# Altium schematic sheet PAGE1.SchDoc
size 1071 x 817 mm
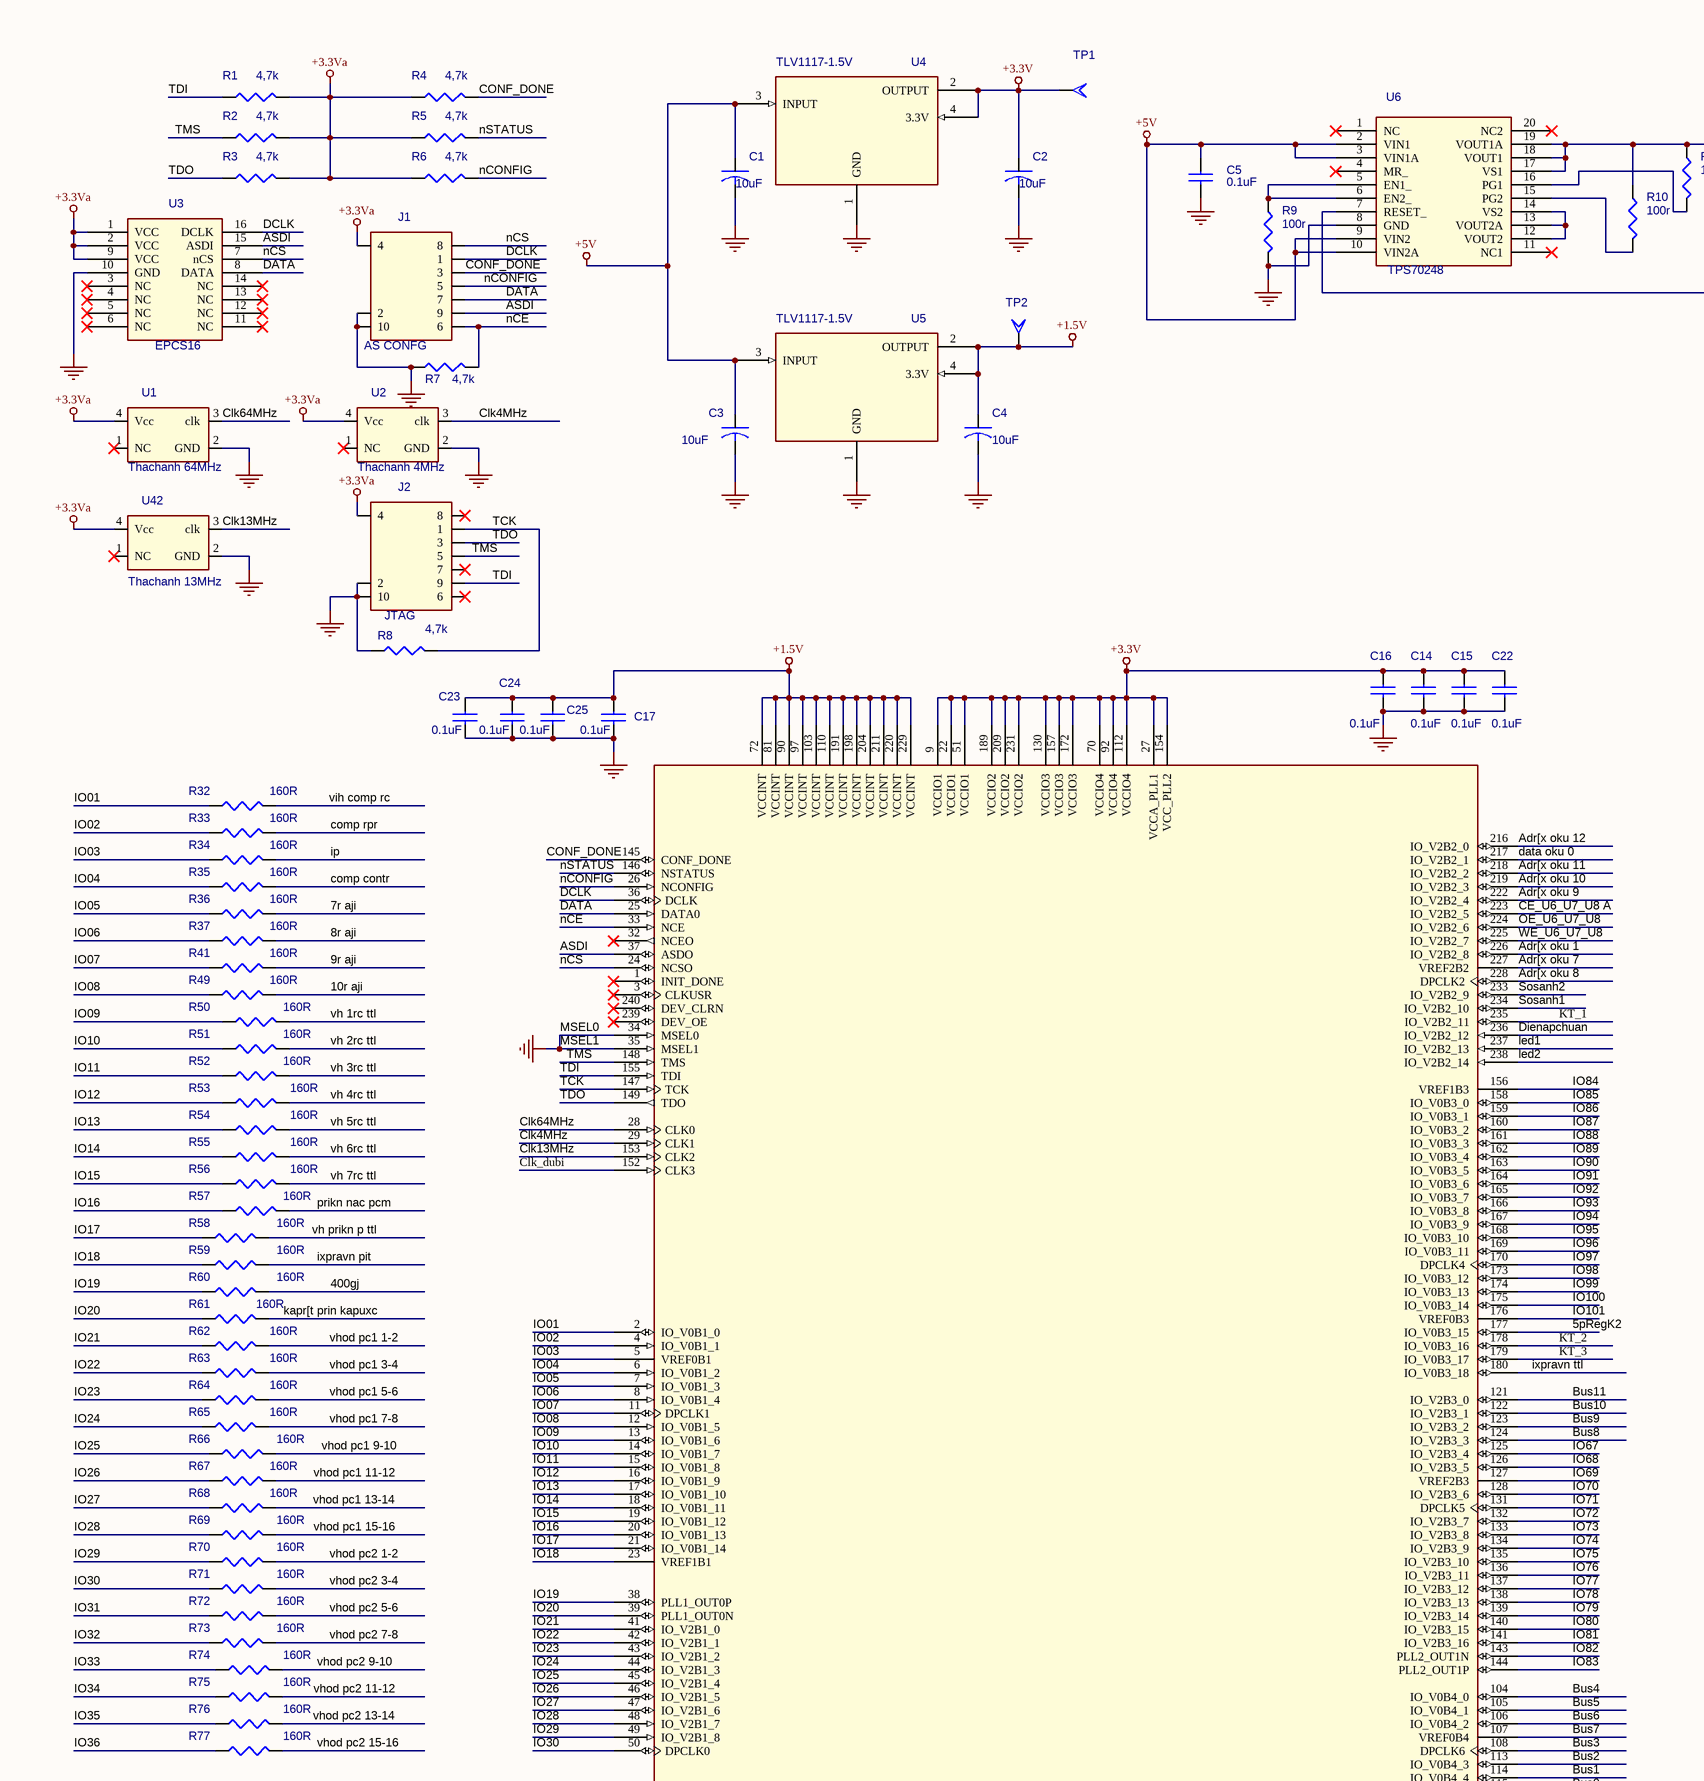
[diagram p0: PAGE1.SchDoc, top left]
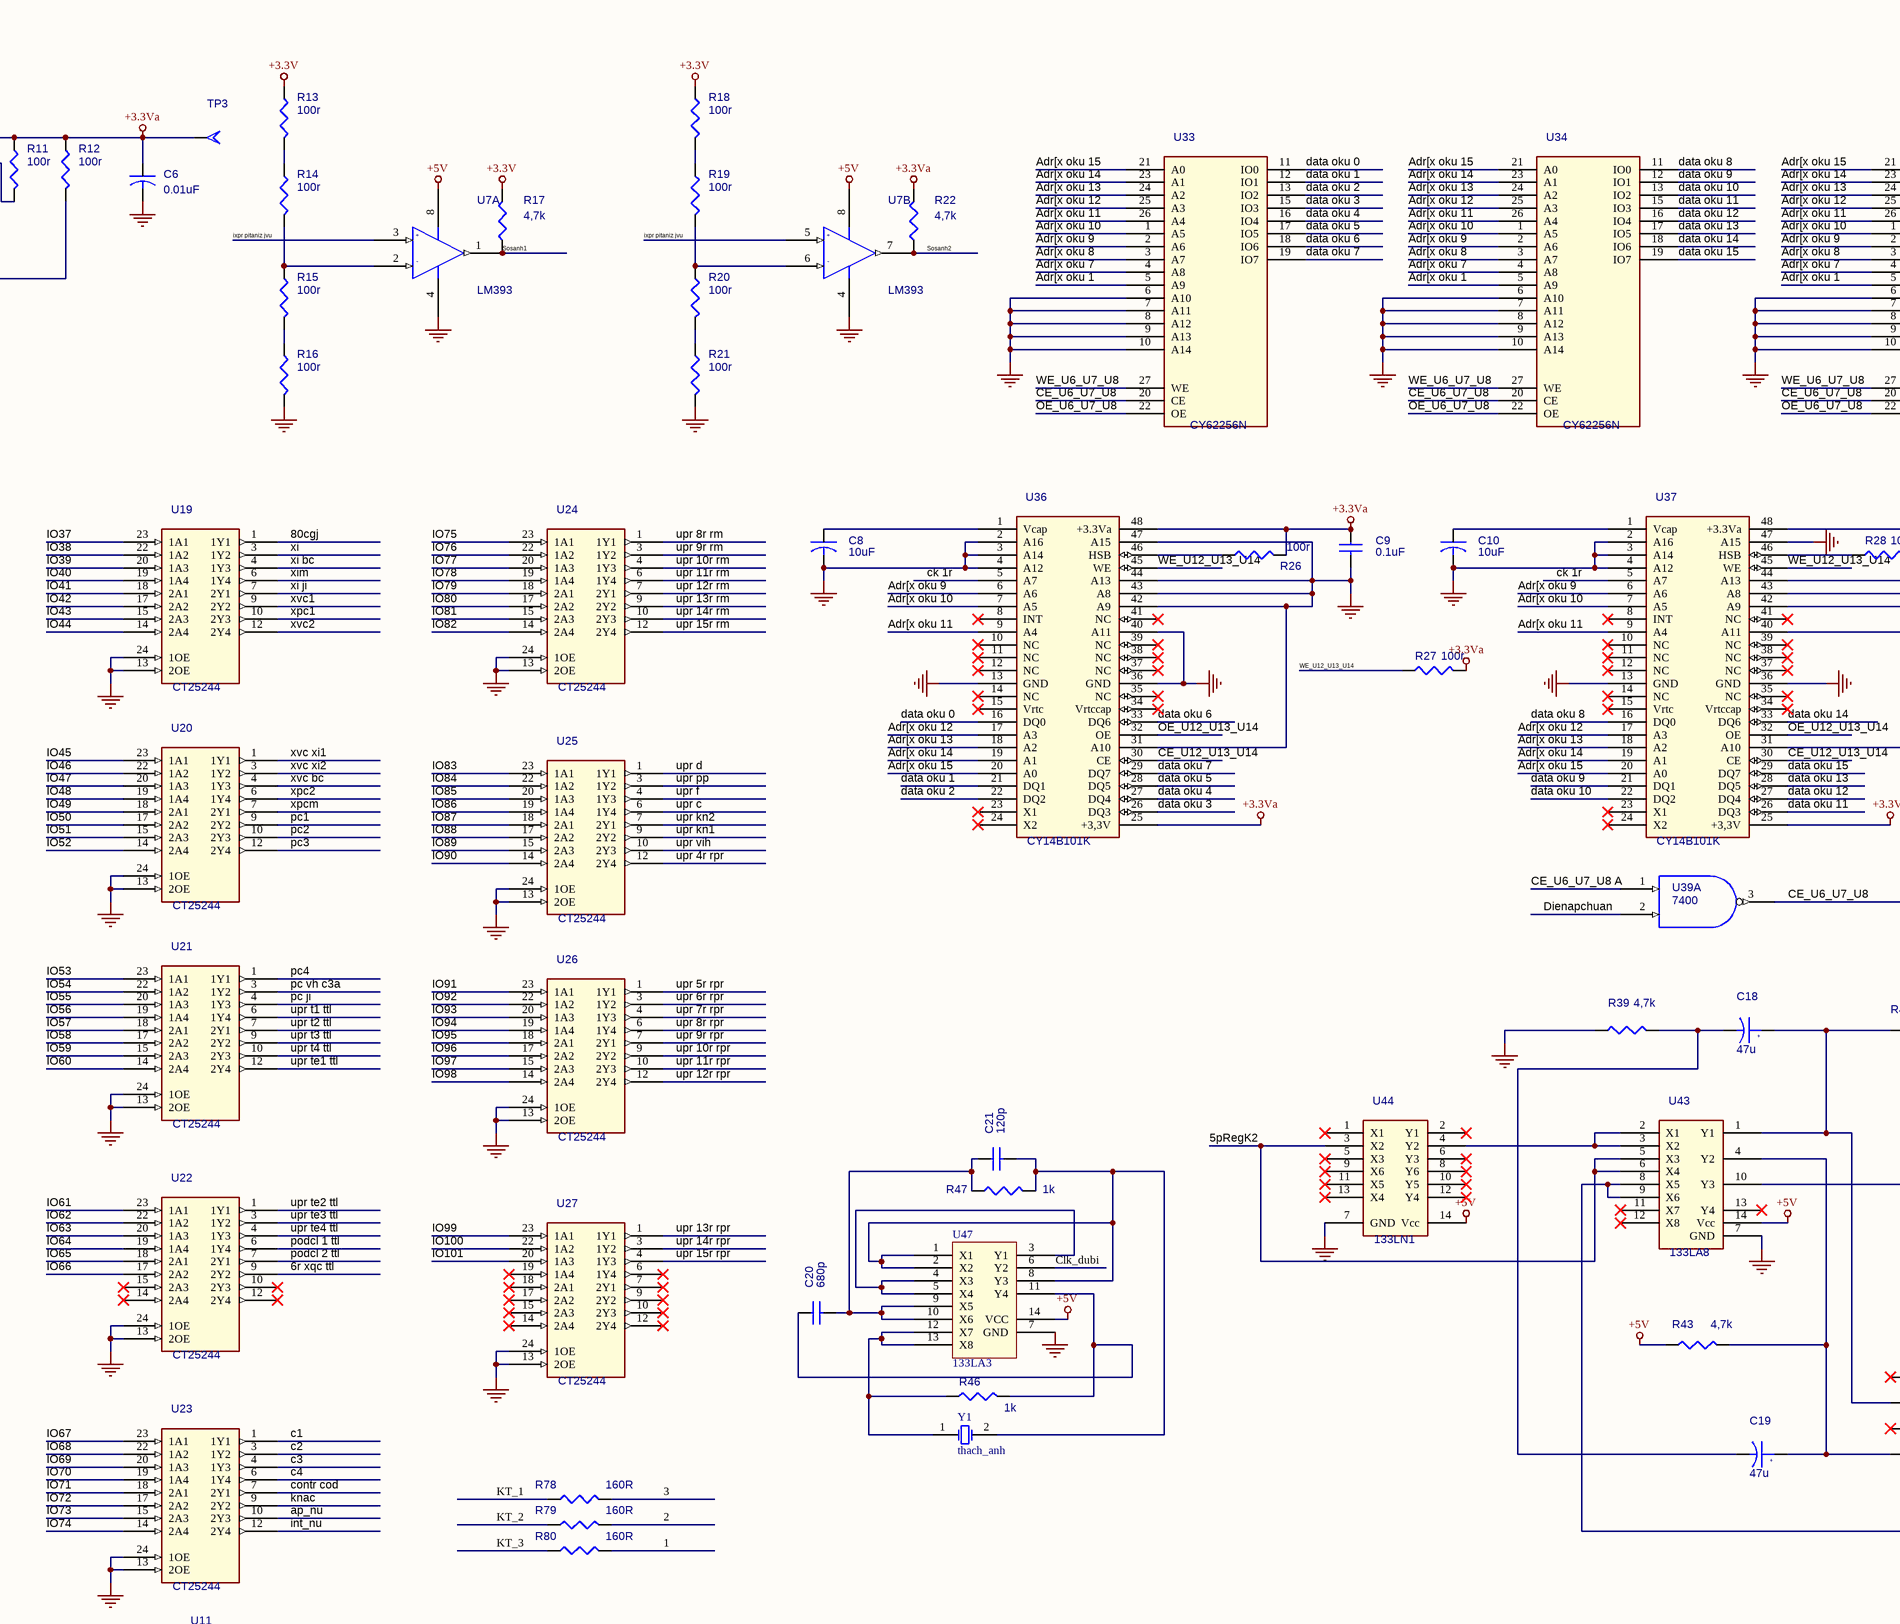
[diagram p1: PAGE1.SchDoc, top middle]
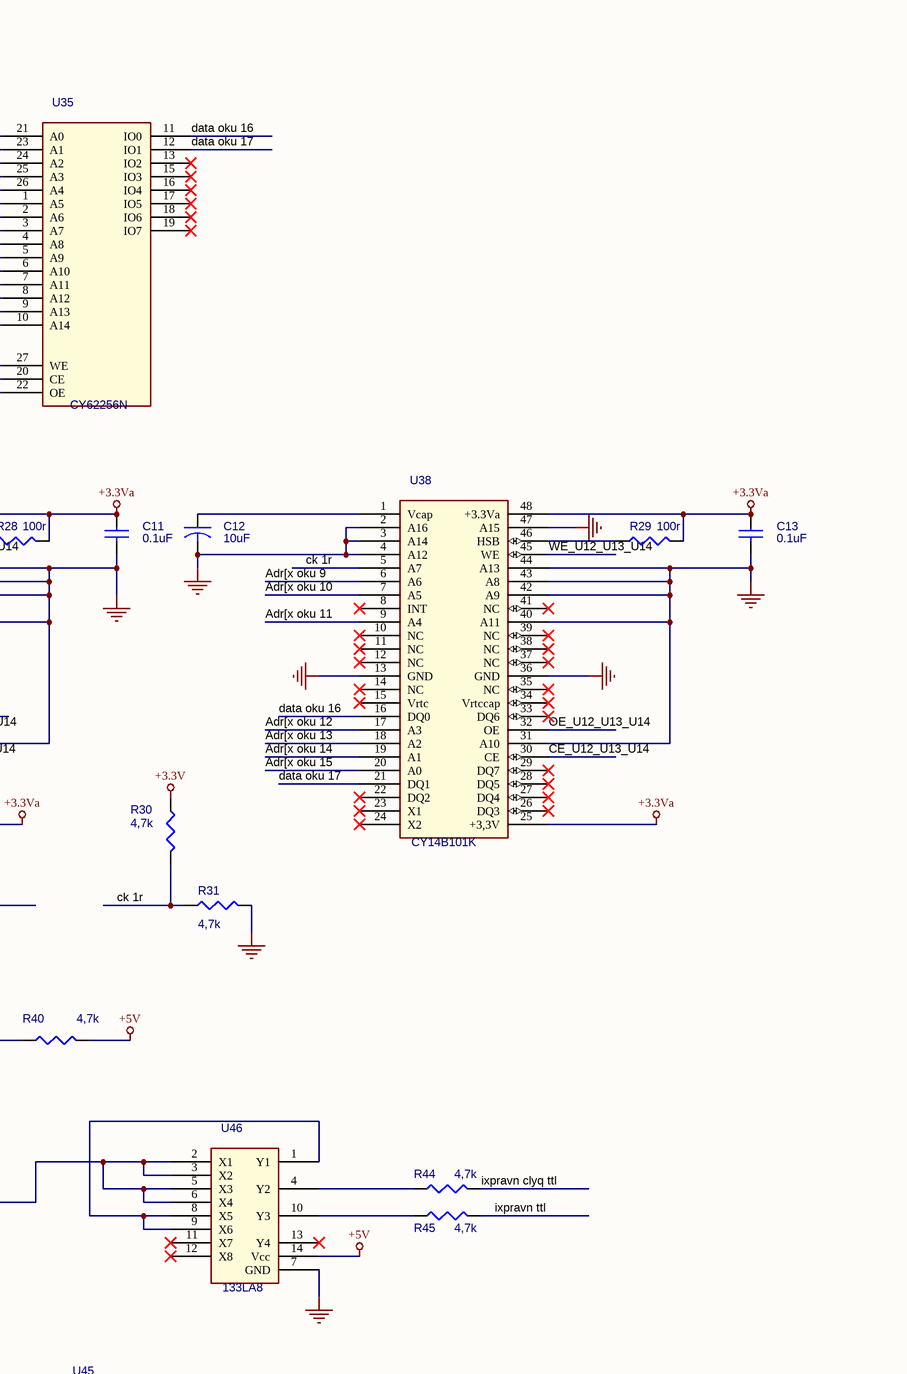
[diagram p2: PAGE1.SchDoc, top right]
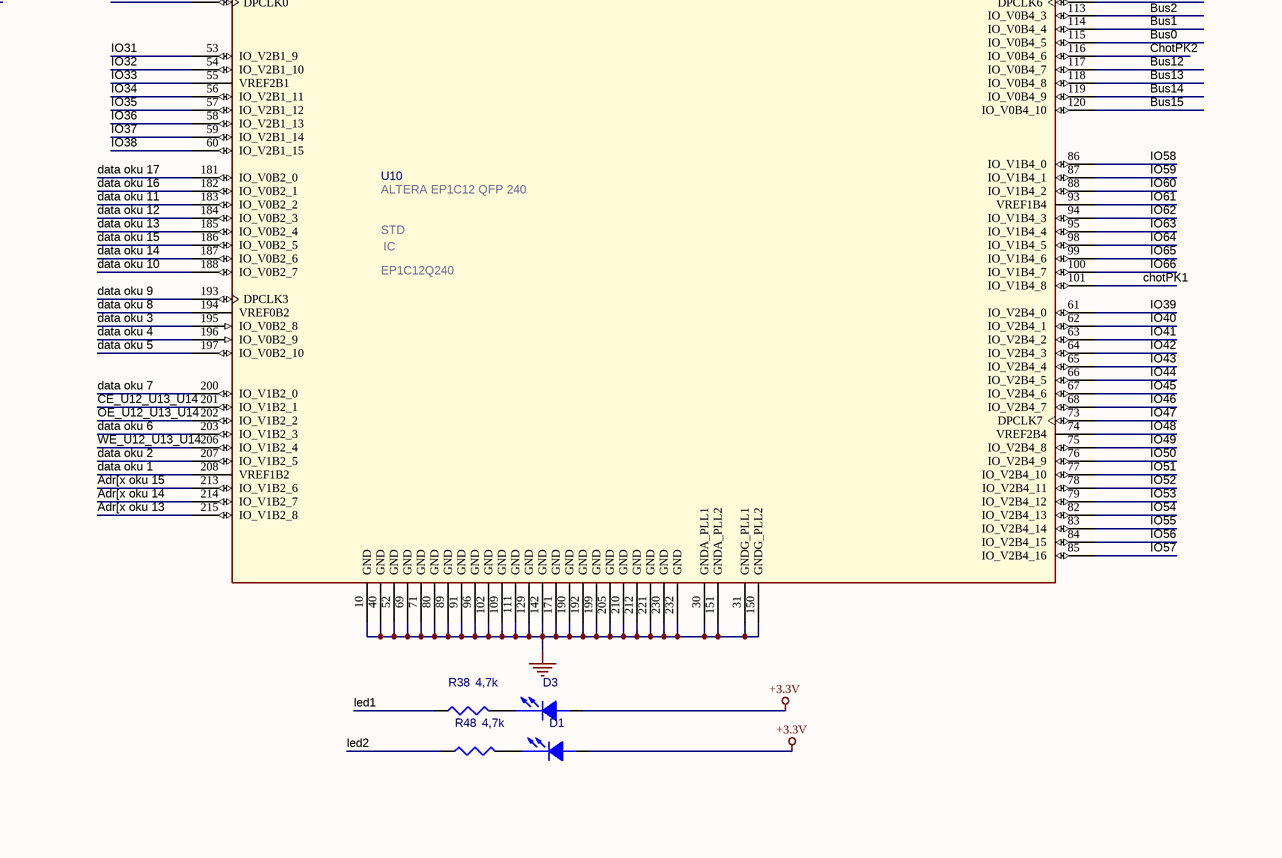
[diagram p3: PAGE1.SchDoc, centre left]
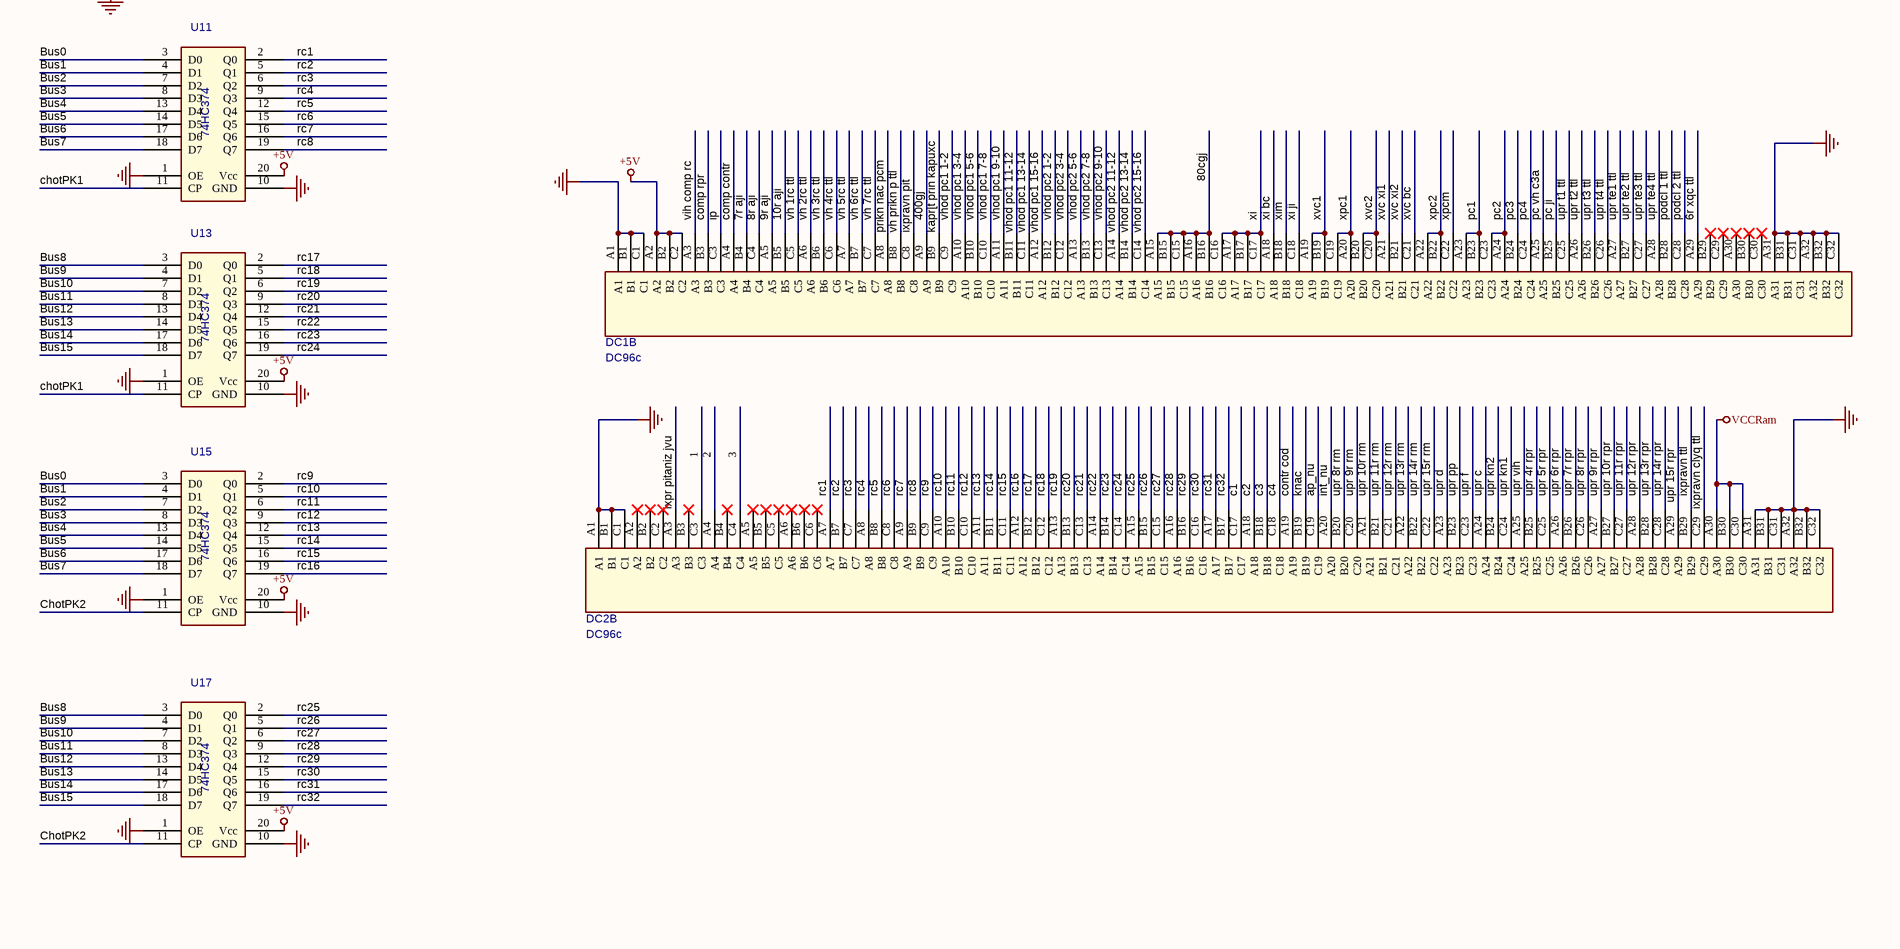
[diagram p4: PAGE1.SchDoc, centre middle]
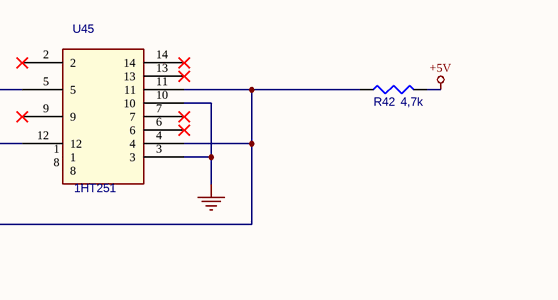
[diagram p5: PAGE1.SchDoc, centre right]
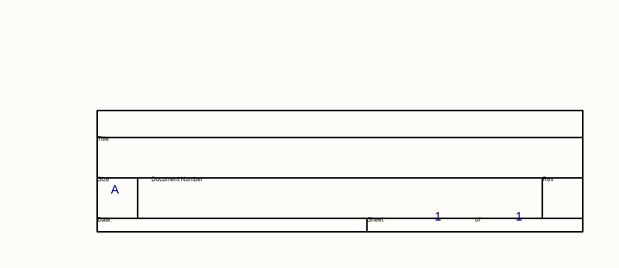
[diagram p6: PAGE1.SchDoc, bottom right]

## Parts
*  Page Size: A  Page Number: 1  (hidden comment: TitleBlock0)  (graphical)
C1  10uF  [tudien]
C2  10uF  [tudien]
C3  10uF  [tudien]
C4  10uF  [tudien]
C5  0.1uF  [C1206]
C6  0.01uF  [tudien]
C8  10uF  [tudien]
C9  0.1uF  [C1206]
C10  10uF  [tudien]
C11  0.1uF  [C1206]
C12  10uF  [tudien]
C13  0.1uF  [C1206]
C14  0.1uF  [C1206]
C15  0.1uF  [C1206]
C16  0.1uF  [C1206]
C17  0.1uF  [C1206]
C18  47u  [tudien]
C19  47u  [tudien]
C20  680p  [C1206]
C21  120p  [C1206]
C22  0.1uF  [C1206]
C23  0.1uF  [C1206]
C24  0.1uF  [C1206]
C25  0.1uF  [C1206]
D1  LED  [3.5X2.8X1.9]  (value not drawn)
D3  LED  [3.5X2.8X1.9]  (value not drawn)
DC1B  DC96c  [DC96c_DUC]
DC2B  DC96c  [DC96c_DUC]
J1  AS CONFG  [HDR2X5]
J2  JTAG  [HDR2X5]
R1  4,7k  [6-0805_N]
R2  4,7k  [6-0805_N]
R3  4,7k  [6-0805_N]
R4  4,7k  [6-0805_N]
R5  4,7k  [6-0805_N]
R6  4,7k  [6-0805_N]
R7  4,7k  [6-0805_N]
R8  4,7k  [6-0805_N]
R9  100r  [6-0805_N]
R10  100r  [6-0805_N]
R11  100r  [6-0805_N]
R12  100r  [6-0805_N]
R13  100r  [6-0805_N]
R14  100r  [6-0805_N]
R15  100r  [6-0805_N]
R16  100r  [6-0805_N]
R17  4,7k  [6-0805_N]
R18  100r  [6-0805_N]
R19  100r  [6-0805_N]
R20  100r  [6-0805_N]
R21  100r  [6-0805_N]
R22  4,7k  [6-0805_N]
R26  100r  [6-0805_N]
R27  100r  [6-0805_N]
R28  100r  [6-0805_N]
R29  100r  [6-0805_N]
R30  4,7k  [6-0805_N]
R31  4,7k  [6-0805_N]
R32  160R  [6-0805_N]
R33  160R  [6-0805_N]
R34  160R  [6-0805_N]
R35  160R  [6-0805_N]
R36  160R  [6-0805_N]
R37  160R  [6-0805_N]
R38  4,7k  [6-0805_N]
R39  4,7k  [6-0805_N]
R40  4,7k  [6-0805_N]
R41  160R  [6-0805_N]
R42  4,7k  [6-0805_N]
R43  4,7k  [6-0805_N]
R44  4,7k  [6-0805_N]
R45  4,7k  [6-0805_N]
R46  1k  [6-0805_N]
R47  1k  [6-0805_N]
R48  4,7k  [6-0805_N]
R49  160R  [6-0805_N]
R50  160R  [6-0805_N]
R51  160R  [6-0805_N]
R52  160R  [6-0805_N]
R53  160R  [6-0805_N]
R54  160R  [6-0805_N]
R55  160R  [6-0805_N]
R56  160R  [6-0805_N]
R57  160R  [6-0805_N]
R58  160R  [6-0805_N]
R59  160R  [6-0805_N]
R60  160R  [6-0805_N]
R61  160R  [6-0805_N]
R62  160R  [6-0805_N]
R63  160R  [6-0805_N]
R64  160R  [6-0805_N]
R65  160R  [6-0805_N]
R66  160R  [6-0805_N]
R67  160R  [6-0805_N]
R68  160R  [6-0805_N]
R69  160R  [6-0805_N]
R70  160R  [6-0805_N]
R71  160R  [6-0805_N]
R72  160R  [6-0805_N]
R73  160R  [6-0805_N]
R74  160R  [6-0805_N]
R75  160R  [6-0805_N]
R76  160R  [6-0805_N]
R77  160R  [6-0805_N]
R78  160R  [6-0805_N]
R79  160R  [6-0805_N]
R80  160R  [6-0805_N]
TP1  T POINT A  [PIN1]  (value not drawn)
TP2  T POINT A  [PIN1]  (value not drawn)
TP3  T POINT A  [PIN1]  (value not drawn)
U1  Thachanh 64MHz  [Thachanh64mhz]
U2  Thachanh 4MHz  [Thachanh64mhz]
U3  EPCS16  [EPCS16]
U4  SymName: TLV1117-1.5V  [SOT223_N]  (hidden comment: tlv1117cdcy)
U5  SymName: TLV1117-1.5V  [SOT223_N]  (hidden comment: tlv1117cdcy)
U6  TPS70248  [TPS70248]
U7  LM393  [SO8_N]  (parts A,B of 2)
U10  CLASS: IC  LEVEL: STD  DEVICE: ALTERA EP1C12 QFP 240  [PQFP240_N]  (hidden comment: EP1C12Q240)
U11  74HC374  [SOIC20/74HC374]
U13  74HC374  [SOIC20/74HC374]
U15  74HC374  [SOIC20/74HC374]
U17  74HC374  [SOIC20/74HC374]
U19  CT25244  [CT25244]
U20  CT25244  [CT25244]
U21  CT25244  [CT25244]
U22  CT25244  [CT25244]
U23  CT25244  [CT25244]
U24  CT25244  [CT25244]
U25  CT25244  [CT25244]
U26  CT25244  [CT25244]
U27  CT25244  [CT25244]
U33  CY62256N  [S22_N]
U34  CY62256N  [S22_N]
U35  CY62256N  [S22_N]
U36  CY14B101K  [O48]
U37  CY14B101K  [O48]
U38  CY14B101K  [O48]
U39  7400  [7400]  (part A of 4)
U42  Thachanh 13MHz  [Thachanh64mhz]
U43  133LA8  [133LA8]
U44  133LN1  [133LA8]
U45  1HT251  [133LA8]
U46  133LA8  [133LA8]
U47  133LA3  [133LA8]
Y1  thach_anh  [OCPG_07]

## Nets
+1.5V: C4.1 C17.1 C23.1 C24.1 C25.1 TP2.1(TP) U5.2(OUTPUT) U5.4(3.3V) U10.72(VCCINT) U10.81(VCCINT) U10.90(VCCINT) U10.97(VCCINT) U10.103(VCCINT) U10.110(VCCINT) U10.191(VCCINT) U10.198(VCCINT) U10.204(VCCINT) U10.211(VCCINT) U10.220(VCCINT) U10.229(VCCINT)
+3.3V: C2.1 C14.1 C15.1 C16.1 C22.1 D1.1(ANODE) D3.1(ANODE) R13.1 R17.1 R18.1 R30.1 TP1.1(TP) U4.2(OUTPUT) U4.4(3.3V) U10.9(VCCIO1) U10.22(VCCIO1) U10.27(VCCA_PLL1) U10.51(VCCIO1) U10.70(VCCIO4) U10.92(VCCIO4) U10.112(VCCIO4) U10.130(VCCIO3) U10.154(VCC_PLL2) U10.157(VCCIO3) U10.172(VCCIO3) U10.189(VCCIO2) U10.209(VCCIO2) U10.231(VCCIO2)
+3.3Va: C6.1 C9.1 C11.1 C13.1 J1.4 J2.4 R1.2 R2.2 R3.2 R4.1 R5.1 R6.1 R10.1 R11.1 R12.1 R22.1 R26.2 R27.2 R28.2 R29.2 TP3.1(TP) U1.4(Vcc) U2.4(Vcc) U3.1(VCC) U3.2(VCC) U3.9(VCC) U6.17(VS1) U6.18(VOUT1) U6.19(VOUT1A) U19.16(+5V) U19.21(+5V) U20.16(+5V) U20.21(+5V) U21.16(+5V) U21.21(+5V) U22.16(+5V) U22.21(+5V) U23.16(+5V) U23.21(+5V) U24.16(+5V) U24.21(+5V) U25.16(+5V) U25.21(+5V) U26.16(+5V) U26.21(+5V) U27.16(+5V) U27.21(+5V) U36.25(+3,3V) U36.48(+3.3Va) U37.25(+3,3V) U37.48(+3.3Va) U38.25(+3,3V) U38.48(+3.3Va) U42.4(Vcc)
+5V: C1.1 C3.1 C5.1 DC1B.A2 DC1B.B2 DC1B.C2 R40.2 R42.2 R43.1 U4.3(INPUT) U5.3(INPUT) U6.2(VIN1) U6.3(VIN1A) U6.9(VIN2) U6.10(VIN2A) U7.8(V+) U11.20(Vcc) U13.20(Vcc) U15.20(Vcc) U17.20(Vcc) U43.14(Vcc) U44.14(Vcc) U46.14(Vcc) U47.14(VCC)
MSEL0: C1.2 C2.2 C3.2 C4.2 C5.2 C6.2 C8.2 C9.2 C10.2 C11.2 C12.2 C13.2 C14.2 C15.2 C16.2 C17.2 C22.2 C23.2 C24.2 C25.2 DC1B.A1 DC1B.A31 DC1B.A32 DC1B.B1 DC1B.B31 DC1B.B32 DC1B.C1 DC1B.C31 DC1B.C32 DC2B.A1 DC2B.A31 DC2B.A32 DC2B.B1 DC2B.B31 DC2B.B32 DC2B.C1 DC2B.C31 DC2B.C32 J1.2 J1.10 J2.2 J2.10 R7.2 R8.1 R9.2 R16.2 R21.2 R31.2 R39.1 U1.2(GND) U2.2(GND) U3.10(GND) U4.1(GND) U5.1(GND) U6.8(GND) U7.4(V-) U10.10(GND) U10.30(GNDA_PLL1) U10.31(GNDG_PLL1) U10.34(MSEL0) U10.35(MSEL1) U10.40(GND) U10.52(GND) U10.69(GND) U10.71(GND) U10.80(GND) U10.89(GND) U10.91(GND) U10.96(GND) U10.102(GND) U10.109(GND) U10.111(GND) U10.129(GND) U10.142(GND) U10.150(GNDG_PLL2) U10.151(GNDA_PLL2) U10.171(GND) U10.190(GND) U10.192(GND) U10.199(GND) U10.205(GND) U10.210(GND) U10.212(GND) U10.221(GND) U10.230(GND) U10.232(GND) U11.1(OE) U11.10(GND) U13.1(OE) U13.10(GND) U15.1(OE) U15.10(GND) U17.1(OE) U17.10(GND) U19.2(GND) U19.5(GND) U19.8(GND) U19.11(GND) U19.13(2OE) U19.24(1OE) U20.2(GND) U20.5(GND) U20.8(GND) U20.11(GND) U20.13(2OE) U20.24(1OE) U21.2(GND) U21.5(GND) U21.8(GND) U21.11(GND) U21.13(2OE) U21.24(1OE) U22.2(GND) U22.5(GND) U22.8(GND) U22.11(GND) U22.13(2OE) U22.24(1OE) U23.2(GND) U23.5(GND) U23.8(GND) U23.11(GND) U23.13(2OE) U23.24(1OE) U24.2(GND) U24.5(GND) U24.8(GND) U24.11(GND) U24.13(2OE) U24.24(1OE) U25.2(GND) U25.5(GND) U25.8(GND) U25.11(GND) U25.13(2OE) U25.24(1OE) U26.2(GND) U26.5(GND) U26.8(GND) U26.11(GND) U26.13(2OE) U26.24(1OE) U27.2(GND) U27.5(GND) U27.8(GND) U27.11(GND) U27.13(2OE) U27.24(1OE) U33.6(A10) U33.7(A11) U33.8(A12) U33.9(A13) U33.10(A14) U33.14(GND) U34.6(A10) U34.7(A11) U34.8(A12) U34.9(A13) U34.10(A14) U34.14(GND) U35.6(A10) U35.7(A11) U35.8(A12) U35.9(A13) U35.10(A14) U35.14(GND) U36.2(A16) U36.3(A14) U36.4(A12) U36.13(GND) U36.31(A10) U36.36(GND) U36.40(A11) U36.42(A9) U36.43(A8) U36.44(A13) U36.47(A15) U37.2(A16) U37.3(A14) U37.4(A12) U37.13(GND) U37.31(A10) U37.36(GND) U37.40(A11) U37.42(A9) U37.43(A8) U37.44(A13) U37.47(A15) U38.2(A16) U38.3(A14) U38.4(A12) U38.13(GND) U38.31(A10) U38.36(GND) U38.40(A11) U38.42(A9) U38.43(A8) U38.44(A13) U38.47(A15) U39.7(GND) U42.2(GND) U43.7(GND) U44.7(GND) U45.3 U45.10 U46.7(GND) U47.7(GND)  [also labelled GND, MSEL1]
VCCRam: DC2B.A30 DC2B.B30 DC2B.C30 U33.28(VCCRam) U34.28(VCCRam) U35.28(VCCRam) U39.14(+5V)
1: DC2B.C3 R80.2
2: DC2B.A4 R79.2
3: DC2B.C4 R78.2
5pRegK2: U10.177(IO_V0B3_15) U43.5(X3) U43.6(X4) U44.3(X2)
6r xqc ttl: DC1B.A29 U22.9(2Y2)
7r aji: DC1B.B4 R36.2
8r aji: DC1B.C4 R37.2
9r aji: DC1B.A5 R41.2
10r aji: DC1B.B5 R49.2
80cgj: DC1B.A15 DC1B.A16 DC1B.B15 DC1B.B16 DC1B.C15 U19.1(1Y1)
400gj: DC1B.A9 R60.2
Adr[x oku 1: U10.226(IO_V2B2_8) U33.5(A9) U34.5(A9) U35.5(A9)
Adr[x oku 7: U10.227(VREF2B2) U33.4(A8) U34.4(A8) U35.4(A8)
Adr[x oku 8: U10.228(DPCLK2) U33.3(A7) U34.3(A7) U35.3(A7)
Adr[x oku 9: U10.222(IO_V2B2_4) U33.2(A6) U34.2(A6) U35.2(A6) U36.6(A6) U37.6(A6) U38.6(A6)
Adr[x oku 10: U10.219(IO_V2B2_3) U33.1(A5) U34.1(A5) U35.1(A5) U36.7(A5) U37.7(A5) U38.7(A5)
Adr[x oku 11: U10.218(IO_V2B2_2) U33.26(A4) U34.26(A4) U35.26(A4) U36.9(A4) U37.9(A4) U38.9(A4)
Adr[x oku 12: U10.216(IO_V2B2_0) U33.25(A3) U34.25(A3) U35.25(A3) U36.17(A3) U37.17(A3) U38.17(A3)
Adr[x oku 13: U10.215(IO_V1B2_8) U33.24(A2) U34.24(A2) U35.24(A2) U36.18(A2) U37.18(A2) U38.18(A2)
Adr[x oku 14: U10.214(IO_V1B2_7) U33.23(A1) U34.23(A1) U35.23(A1) U36.19(A1) U37.19(A1) U38.19(A1)
Adr[x oku 15: U10.213(IO_V1B2_6) U33.21(A0) U34.21(A0) U35.21(A0) U36.20(A0) U37.20(A0) U38.20(A0)
ap_nu: DC2B.C19 U23.10(2Y3)
ASDI: J1.9 U3.15(ASDI) U10.37(ASDO)
Bus0: U10.115(IO_V0B4_5) U11.3(D0) U15.3(D0)
Bus1: U10.114(IO_V0B4_4) U11.4(D1) U15.4(D1)
Bus2: U10.113(IO_V0B4_3) U11.7(D2) U15.7(D2)
Bus3: U10.108(DPCLK6) U11.8(D3) U15.8(D3)
Bus4: U10.104(IO_V0B4_0) U11.13(D4) U15.13(D4)
Bus5: U10.105(IO_V0B4_1) U11.14(D5) U15.14(D5)
Bus6: U10.106(IO_V0B4_2) U11.17(D6) U15.17(D6)
Bus7: U10.107(VREF0B4) U11.18(D7) U15.18(D7)
Bus8: U10.124(IO_V2B3_3) U13.3(D0) U17.3(D0)
Bus9: U10.123(IO_V2B3_2) U13.4(D1) U17.4(D1)
Bus10: U10.122(IO_V2B3_1) U13.7(D2) U17.7(D2)
Bus11: U10.121(IO_V2B3_0) U13.8(D3) U17.8(D3)
Bus12: U10.117(IO_V0B4_7) U13.13(D4) U17.13(D4)
Bus13: U10.118(IO_V0B4_8) U13.14(D5) U17.14(D5)
Bus14: U10.119(IO_V0B4_9) U13.17(D6) U17.17(D6)
Bus15: U10.120(IO_V0B4_10) U13.18(D7) U17.18(D7)
c1: DC2B.C17 U23.1(1Y1)
c2: DC2B.A18 U23.3(1Y2)
c3: DC2B.B18 U23.4(1Y3)
c4: DC2B.C18 U23.6(1Y4)
CE_U6_U7_U8: U33.20(CE) U34.20(CE) U35.20(CE) U39.3(Y)
CE_U6_U7_U8 A: U10.223(IO_V2B2_5) U39.1(A)
CE_U12_U13_U14: U10.201(IO_V1B2_1) U36.30(CE) U37.30(CE) U38.30(CE)
chotPK1: U10.101(IO_V1B4_8) U11.11(CP) U13.11(CP)
ChotPK2: U10.116(IO_V0B4_6) U15.11(CP) U17.11(CP)
ck 1r: R30.2 R31.1 U36.5(A7) U37.5(A7) U38.5(A7)
Clk4MHz: U2.3(clk) U10.29(CLK1)
Clk13MHz: U10.153(CLK2) U42.3(clk)
Clk64MHz: U1.3(clk) U10.28(CLK0)
Clk_dubi: U10.152(CLK3) U47.6(Y2)
comp contr: DC1B.A4 R35.2
comp rpr: DC1B.B3 R33.2
CONF_DONE: J1.3 R4.2 U10.145(CONF_DONE)
contr cod: DC2B.A19 U23.7(2Y1)
DATA: J1.7 U3.8(DATA) U10.25(DATA0)
data oku 0: U10.217(IO_V2B2_1) U33.11(IO0) U36.16(DQ0)
data oku 1: U10.208(VREF1B2) U33.12(IO1) U36.21(DQ1)
data oku 2: U10.207(IO_V1B2_5) U33.13(IO2) U36.22(DQ2)
data oku 3: U10.195(IO_V0B2_8) U33.15(IO3) U36.26(DQ3)
data oku 4: U10.196(IO_V0B2_9) U33.16(IO4) U36.27(DQ4)
data oku 5: U10.197(IO_V0B2_10) U33.17(IO5) U36.28(DQ5)
data oku 6: U10.203(IO_V1B2_3) U33.18(IO6) U36.33(DQ6)
data oku 7: U10.200(IO_V1B2_0) U33.19(IO7) U36.29(DQ7)
data oku 8: U10.194(VREF0B2) U34.11(IO0) U37.16(DQ0)
data oku 9: U10.193(DPCLK3) U34.12(IO1) U37.21(DQ1)
data oku 10: U10.188(IO_V0B2_7) U34.13(IO2) U37.22(DQ2)
data oku 11: U10.183(IO_V0B2_2) U34.15(IO3) U37.26(DQ3)
data oku 12: U10.184(IO_V0B2_3) U34.16(IO4) U37.27(DQ4)
data oku 13: U10.185(IO_V0B2_4) U34.17(IO5) U37.28(DQ5)
data oku 14: U10.187(IO_V0B2_6) U34.18(IO6) U37.33(DQ6)
data oku 15: U10.186(IO_V0B2_5) U34.19(IO7) U37.29(DQ7)
data oku 16: U10.182(IO_V0B2_1) U35.11(IO0) U38.16(DQ0)
data oku 17: U10.181(IO_V0B2_0) U35.12(IO1) U38.21(DQ1)
DCLK: J1.1 U3.16(DCLK) U10.36(DCLK)
Dienapchuan: U10.236(IO_V2B2_12) U39.2(B)
int_nu: DC2B.A20 U23.12(2Y4)
IO01: R32.1 U10.2(IO_V0B1_0)
IO02: R33.1 U10.4(IO_V0B1_1)
IO03: R34.1 U10.5(VREF0B1)
IO04: R35.1 U10.6(IO_V0B1_2)
IO05: R36.1 U10.7(IO_V0B1_3)
IO06: R37.1 U10.8(IO_V0B1_4)
IO07: R41.1 U10.11(DPCLK1)
IO08: R49.1 U10.12(IO_V0B1_5)
IO09: R50.1 U10.13(IO_V0B1_6)
IO10: R51.1 U10.14(IO_V0B1_7)
IO11: R52.1 U10.15(IO_V0B1_8)
IO12: R53.1 U10.16(IO_V0B1_9)
IO13: R54.1 U10.17(IO_V0B1_10)
IO14: R55.1 U10.18(IO_V0B1_11)
IO15: R56.1 U10.19(IO_V0B1_12)
IO16: R57.1 U10.20(IO_V0B1_13)
IO17: R58.1 U10.21(IO_V0B1_14)
IO18: R59.1 U10.23(VREF1B1)
IO19: R60.1 U10.38(PLL1_OUT0P)
IO20: R61.1 U10.39(PLL1_OUT0N)
IO21: R62.1 U10.41(IO_V2B1_0)
IO22: R63.1 U10.42(IO_V2B1_1)
IO23: R64.1 U10.43(IO_V2B1_2)
IO24: R65.1 U10.44(IO_V2B1_3)
IO25: R66.1 U10.45(IO_V2B1_4)
IO26: R67.1 U10.46(IO_V2B1_5)
IO27: R68.1 U10.47(IO_V2B1_6)
IO28: R69.1 U10.48(IO_V2B1_7)
IO29: R70.1 U10.49(IO_V2B1_8)
IO30: R71.1 U10.50(DPCLK0)
IO31: R72.1 U10.53(IO_V2B1_9)
IO32: R73.1 U10.54(IO_V2B1_10)
IO33: R74.1 U10.55(VREF2B1)
IO34: R75.1 U10.56(IO_V2B1_11)
IO35: R76.1 U10.57(IO_V2B1_12)
IO36: R77.1 U10.58(IO_V2B1_13)
IO37: U10.59(IO_V2B1_14) U19.23(1A1)
IO38: U10.60(IO_V2B1_15) U19.22(1A2)
IO39: U10.61(IO_V2B4_0) U19.20(1A3)
IO40: U10.62(IO_V2B4_1) U19.19(1A4)
IO41: U10.63(IO_V2B4_2) U19.18(2A1)
IO42: U10.64(IO_V2B4_3) U19.17(2A2)
IO43: U10.65(IO_V2B4_4) U19.15(2A3)
IO44: U10.66(IO_V2B4_5) U19.14(2A4)
IO45: U10.67(IO_V2B4_6) U20.23(1A1)
IO46: U10.68(IO_V2B4_7) U20.22(1A2)
IO47: U10.73(DPCLK7) U20.20(1A3)
IO48: U10.74(VREF2B4) U20.19(1A4)
IO49: U10.75(IO_V2B4_8) U20.18(2A1)
IO50: U10.76(IO_V2B4_9) U20.17(2A2)
IO51: U10.77(IO_V2B4_10) U20.15(2A3)
IO52: U10.78(IO_V2B4_11) U20.14(2A4)
IO53: U10.79(IO_V2B4_12) U21.23(1A1)
IO54: U10.82(IO_V2B4_13) U21.22(1A2)
IO55: U10.83(IO_V2B4_14) U21.20(1A3)
IO56: U10.84(IO_V2B4_15) U21.19(1A4)
IO57: U10.85(IO_V2B4_16) U21.18(2A1)
IO58: U10.86(IO_V1B4_0) U21.17(2A2)
IO59: U10.87(IO_V1B4_1) U21.15(2A3)
IO60: U10.88(IO_V1B4_2) U21.14(2A4)
IO61: U10.93(VREF1B4) U22.23(1A1)
IO62: U10.94(IO_V1B4_3) U22.22(1A2)
IO63: U10.95(IO_V1B4_4) U22.20(1A3)
IO64: U10.98(IO_V1B4_5) U22.19(1A4)
IO65: U10.99(IO_V1B4_6) U22.18(2A1)
IO66: U10.100(IO_V1B4_7) U22.17(2A2)
IO67: U10.125(IO_V2B3_4) U23.23(1A1)
IO68: U10.126(IO_V2B3_5) U23.22(1A2)
IO69: U10.127(VREF2B3) U23.20(1A3)
IO70: U10.128(IO_V2B3_6) U23.19(1A4)
IO71: U10.131(DPCLK5) U23.18(2A1)
IO72: U10.132(IO_V2B3_7) U23.17(2A2)
IO73: U10.133(IO_V2B3_8) U23.15(2A3)
IO74: U10.134(IO_V2B3_9) U23.14(2A4)
IO75: U10.135(IO_V2B3_10) U24.23(1A1)
IO76: U10.136(IO_V2B3_11) U24.22(1A2)
IO77: U10.137(IO_V2B3_12) U24.20(1A3)
IO78: U10.138(IO_V2B3_13) U24.19(1A4)
IO79: U10.139(IO_V2B3_14) U24.18(2A1)
IO80: U10.140(IO_V2B3_15) U24.17(2A2)
IO81: U10.141(IO_V2B3_16) U24.15(2A3)
IO82: U10.143(PLL2_OUT1N) U24.14(2A4)
IO83: U10.144(PLL2_OUT1P) U25.23(1A1)
IO84: U10.156(VREF1B3) U25.22(1A2)
IO85: U10.158(IO_V0B3_0) U25.20(1A3)
IO86: U10.159(IO_V0B3_1) U25.19(1A4)
IO87: U10.160(IO_V0B3_2) U25.18(2A1)
IO88: U10.161(IO_V0B3_3) U25.17(2A2)
IO89: U10.162(IO_V0B3_4) U25.15(2A3)
IO90: U10.163(IO_V0B3_5) U25.14(2A4)
IO91: U10.164(IO_V0B3_6) U26.23(1A1)
IO92: U10.165(IO_V0B3_7) U26.22(1A2)
IO93: U10.166(IO_V0B3_8) U26.20(1A3)
IO94: U10.167(IO_V0B3_9) U26.19(1A4)
IO95: U10.168(IO_V0B3_10) U26.18(2A1)
IO96: U10.169(IO_V0B3_11) U26.17(2A2)
IO97: U10.170(DPCLK4) U26.15(2A3)
IO98: U10.173(IO_V0B3_12) U26.14(2A4)
IO99: U10.174(IO_V0B3_13) U27.23(1A1)
IO100: U10.175(IO_V0B3_14) U27.22(1A2)
IO101: U10.176(VREF0B3) U27.20(1A3)
ip: DC1B.C3 R34.2
ixpr pitaniz jvu: DC2B.A3 U7.3(+IN) U7.5(+IN)
ixpravn clyq ttl: DC2B.C29 R44.2
ixpravn pit: DC1B.C8 R59.2
ixpravn ttl: DC2B.B29 R45.2 U10.180(IO_V0B3_18)
kapr[t prin kapuxc: DC1B.B9 R61.2
knac: DC2B.B19 U23.9(2Y2)
KT_1: R78.1 U10.235(IO_V2B2_11)
KT_2: R79.1 U10.178(IO_V0B3_16)
KT_3: R80.1 U10.179(IO_V0B3_17)
led1: R38.1 U10.237(IO_V2B2_13)
led2: R48.1 U10.238(IO_V2B2_14)
nCE: J1.6 R7.1 U10.33(NCE)
nCONFIG: J1.5 R6.2 U10.26(NCONFIG)
nCS: J1.8 U3.7(nCS) U10.24(NCSO)
nSTATUS: R5.2 U10.146(NSTATUS)
OE_U6_U7_U8: U10.224(IO_V2B2_6) U33.22(OE) U34.22(OE) U35.22(OE)
OE_U12_U13_U14: U10.202(IO_V1B2_2) U36.32(OE) U37.32(OE) U38.32(OE)
pc1: DC1B.A23 DC1B.B23 U20.9(2Y2)
pc2: DC1B.A24 DC1B.C23 U20.10(2Y3)
pc3: DC1B.B24 U20.12(2Y4)
pc4: DC1B.C24 U21.1(1Y1)
pc ji: DC1B.B25 U21.4(1Y3)
pc vh c3a: DC1B.A25 U21.3(1Y2)
podcl 1 ttl: DC1B.B28 U22.6(1Y4)
podcl 2 ttl: DC1B.C28 U22.7(2Y1)
prikn nac pcm: DC1B.A8 R57.2
rc1: DC2B.A7 U11.2(Q0)
rc2: DC2B.B7 U11.5(Q1)
rc3: DC2B.C7 U11.6(Q2)
rc4: DC2B.A8 U11.9(Q3)
rc5: DC2B.B8 U11.12(Q4)
rc6: DC2B.C8 U11.15(Q5)
rc7: DC2B.A9 U11.16(Q6)
rc8: DC2B.B9 U11.19(Q7)
rc9: DC2B.C9 U15.2(Q0)
rc10: DC2B.A10 U15.5(Q1)
rc11: DC2B.B10 U15.6(Q2)
rc12: DC2B.C10 U15.9(Q3)
rc13: DC2B.A11 U15.12(Q4)
rc14: DC2B.B11 U15.15(Q5)
rc15: DC2B.C11 U15.16(Q6)
rc16: DC2B.A12 U15.19(Q7)
rc17: DC2B.B12 U13.2(Q0)
rc18: DC2B.C12 U13.5(Q1)
rc19: DC2B.A13 U13.6(Q2)
rc20: DC2B.B13 U13.9(Q3)
rc21: DC2B.C13 U13.12(Q4)
rc22: DC2B.A14 U13.15(Q5)
rc23: DC2B.B14 U13.16(Q6)
rc24: DC2B.C14 U13.19(Q7)
rc25: DC2B.A15 U17.2(Q0)
rc26: DC2B.B15 U17.5(Q1)
rc27: DC2B.C15 U17.6(Q2)
rc28: DC2B.A16 U17.9(Q3)
rc29: DC2B.B16 U17.12(Q4)
rc30: DC2B.C16 U17.15(Q5)
rc31: DC2B.A17 U17.16(Q6)
rc32: DC2B.B17 U17.19(Q7)
Sosanh1: R17.2 U7.1(OUT) U10.234(IO_V2B2_10)
Sosanh2: R22.2 U7.7(OUT) U10.233(IO_V2B2_9)
TCK: J2.1 R8.2 U10.147(TCK)
TDI: J2.9 R1.1 U10.155(TDI)
TDO: J2.3 R3.1 U10.149(TDO)
TMS: J2.5 R2.1 U10.148(TMS)
upr 4r rpr: DC2B.B25 U25.12(2Y4)
upr 5r rpr: DC2B.C25 U26.1(1Y1)
upr 6r rpr: DC2B.A26 U26.3(1Y2)
upr 7r rpr: DC2B.B26 U26.4(1Y3)
upr 8r rm: DC2B.B20 U24.1(1Y1)
upr 8r rpr: DC2B.C26 U26.6(1Y4)
upr 9r rm: DC2B.C20 U24.3(1Y2)
upr 9r rpr: DC2B.A27 U26.7(2Y1)
upr 10r rm: DC2B.A21 U24.4(1Y3)
upr 10r rpr: DC2B.B27 U26.9(2Y2)
upr 11r rm: DC2B.B21 U24.6(1Y4)
upr 11r rpr: DC2B.C27 U26.10(2Y3)
upr 12r rm: DC2B.C21 U24.7(2Y1)
upr 12r rpr: DC2B.A28 U26.12(2Y4)
upr 13r rm: DC2B.A22 U24.9(2Y2)
upr 13r rpr: DC2B.B28 U27.1(1Y1)
upr 14r rm: DC2B.B22 U24.10(2Y3)
upr 14r rpr: DC2B.C28 U27.3(1Y2)
upr 15r rm: DC2B.C22 U24.12(2Y4)
upr 15r rpr: DC2B.A29 U27.4(1Y3)
upr c: DC2B.A24 U25.6(1Y4)
upr d: DC2B.A23 U25.1(1Y1)
upr f: DC2B.C23 U25.4(1Y3)
upr kn1: DC2B.C24 U25.9(2Y2)
upr kn2: DC2B.B24 U25.7(2Y1)
upr pp: DC2B.B23 U25.3(1Y2)
upr t1 ttl: DC1B.C25 U21.6(1Y4)
upr t2 ttl: DC1B.A26 U21.7(2Y1)
upr t3 ttl: DC1B.B26 U21.9(2Y2)
upr t4 ttl: DC1B.C26 U21.10(2Y3)
upr te1 ttl: DC1B.A27 U21.12(2Y4)
upr te2 ttl: DC1B.B27 U22.1(1Y1)
upr te3 ttl: DC1B.C27 U22.3(1Y2)
upr te4 ttl: DC1B.A28 U22.4(1Y3)
upr vih: DC2B.A25 U25.10(2Y3)
vh 1rc ttl: DC1B.C5 R50.2
vh 2rc ttl: DC1B.A6 R51.2
vh 3rc ttl: DC1B.B6 R52.2
vh 4rc ttl: DC1B.C6 R53.2
vh 5rc ttl: DC1B.A7 R54.2
vh 6rc ttl: DC1B.B7 R55.2
vh 7rc ttl: DC1B.C7 R56.2
vh prikn p ttl: DC1B.B8 R58.2
vhod pc1 1-2: DC1B.C9 R62.2
vhod pc1 3-4: DC1B.A10 R63.2
vhod pc1 5-6: DC1B.B10 R64.2
vhod pc1 7-8: DC1B.C10 R65.2
vhod pc1 9-10: DC1B.A11 R66.2
vhod pc1 11-12: DC1B.B11 R67.2
vhod pc1 13-14: DC1B.C11 R68.2
vhod pc1 15-16: DC1B.A12 R69.2
vhod pc2 1-2: DC1B.B12 R70.2
vhod pc2 3-4: DC1B.C12 R71.2
vhod pc2 5-6: DC1B.A13 R72.2
vhod pc2 7-8: DC1B.B13 R73.2
vhod pc2 9-10: DC1B.C13 R74.2
vhod pc2 11-12: DC1B.A14 R75.2
vhod pc2 13-14: DC1B.B14 R76.2
vhod pc2 15-16: DC1B.C14 R77.2
vih comp rc: DC1B.A3 R32.2
WE_U6_U7_U8: U10.225(IO_V2B2_7) U33.27(WE) U34.27(WE) U35.27(WE)
WE_U12_U13_U14: R27.1 U10.206(IO_V1B2_4) U36.45(WE) U37.45(WE) U38.45(WE)
xi: DC1B.A17 DC1B.B17 DC1B.C16 DC1B.C17 U19.3(1Y2)
xi bc: DC1B.A18 U19.4(1Y3)
xi ji: DC1B.C18 U19.7(2Y1)
xim: DC1B.B18 U19.6(1Y4)
xpc1: DC1B.A20 DC1B.C19 U19.10(2Y3)
xpc2: DC1B.A22 DC1B.B22 U20.6(1Y4)
xpcm: DC1B.C22 U20.7(2Y1)
xvc1: DC1B.A19 DC1B.B19 U19.9(2Y2)
xvc2: DC1B.B20 DC1B.C20 U19.12(2Y4)
xvc bc: DC1B.C21 U20.4(1Y3)
xvc xi1: DC1B.A21 U20.1(1Y1)
xvc xi2: DC1B.B21 U20.3(1Y2)
NetC8_1: C8.1 U36.1(Vcap)
NetC10_1: C10.1 U37.1(Vcap)
NetC12_1: C12.1 U38.1(Vcap)
NetC18_1: C18.1 R40.1 U43.1(Y1) U45.5
NetC18_2: C18.2 C19.2 R39.2
NetC19_1: C19.1 R43.2 U43.4(Y2) U45.12
NetC20_1: C20.1 R46.2 U47.11(Y4)
NetC20_2: C20.2 C21.1 R47.1 U47.9(X5) U47.10(X6)
NetC21_2: C21.2 R47.2 U47.1(X1) U47.2(X2) U47.8(Y3) Y1.2(OSC2)
NetD1_2: D1.2(CATHODE) R48.2
NetD3_2: D3.2(CATHODE) R38.2
NetR9_1: R9.1 U6.5(EN1_) U6.6(EN2_)
NetR10_2: R10.2 U6.15(PG2)
NetR11_2: R11.2 U6.16(PG1)
NetR12_2: R12.2 U6.7(RESET_)
NetR13_2: R13.2 R14.1
NetR14_2: R14.2 R15.1 U7.2(-IN)
NetR15_2: R15.2 R16.1
NetR18_2: R18.2 R19.1
NetR19_2: R19.2 R20.1 U7.6(-IN)
NetR20_2: R20.2 R21.1
NetR26_1: R26.1 U36.46(HSB)
NetR28_1: R28.1 U37.46(HSB)
NetR29_1: R29.1 U38.46(HSB)
NetR42_1: R42.1 U43.8(X5) U43.9(X6) U45.4 U45.11
NetR44_1: R44.1 U46.4(Y2)
NetR45_1: R45.1 U46.10(Y3)
NetR46_1: R46.1 U47.12(X7) U47.13(X8) Y1.1(OSC1)
NetU6_12: U6.12(VOUT2) U6.13(VOUT2A) U6.14(VS2)
NetU43_2: U43.2(X1) U43.3(X2) U44.4(Y2)
NetU43_10: U43.10(Y3) U46.2(X1) U46.3(X2) U46.5(X3) U46.6(X4)
NetU46_1: U46.1(Y1) U46.8(X5) U46.9(X6)
NetU47_3: U47.3(Y1) U47.4(X3) U47.5(X4)

Not connected (* = marked no-connect by the designer): DC1B A30* B29* B30* C29* C30*; DC2B A2* A5* A6* B2* B3* B4* B5* B6* C2* C5* C6*; J2 6* 7* 8*; U1 1(NC)*; U2 1(NC)*; U3 3(NC)* 4(NC)* 5(NC)* 6(NC)* 11(NC)* 12(NC)* 13(NC)* 14(NC)*; U6 1(NC)* 4(MR_)* 11(NC1)* 20(NC2)*; U10 1(INIT_DONE)* 3(CLKUSR)* 32(NCEO)* 239(DEV_OE)* 240(DEV_CLRN)*; U22 10(2Y3)* 12(2Y4)* 14(2A4)* 15(2A3)*; U27 6(1Y4)* 7(2Y1)* 9(2Y2)* 10(2Y3)* 12(2Y4)* 14(2A4)* 15(2A3)* 17(2A2)* 18(2A1)* 19(1A4)*; U35 13(IO2)* 15(IO3)* 16(IO4)* 17(IO5)* 18(IO6)* 19(IO7)*; U36 8(INT)* 10(NC)* 11(NC)* 12(NC)* 14(NC)* 15(Vrtc)* 23(X1)* 24(X2)* 34(Vrtccap)* 35(NC)* 37(NC)* 38(NC)* 39(NC)* 41(NC)*; U37 8(INT)* 10(NC)* 11(NC)* 12(NC)* 14(NC)* 15(Vrtc)* 23(X1)* 24(X2)* 34(Vrtccap)* 35(NC)* 37(NC)* 38(NC)* 39(NC)* 41(NC)*; U38 8(INT)* 10(NC)* 11(NC)* 12(NC)* 14(NC)* 15(Vrtc)* 22(DQ2)* 23(X1)* 24(X2)* 26(DQ3)* 27(DQ4)* 28(DQ5)* 29(DQ7)* 33(DQ6)* 34(Vrtccap)* 35(NC)* 37(NC)* 38(NC)* 39(NC)* 41(NC)*; U42 1(NC)*; U43 11(X7)* 12(X8)* 13(Y4)*; U44 1(X1)* 2(Y1)* 5(X3)* 6(Y3)* 8(Y6)* 9(X6)* 10(Y5)* 11(X5)* 12(Y4)* 13(X4)*; U45 1 2* 6* 7* 8 9* 13* 14*; U46 11(X7)* 12(X8)* 13(Y4)*

## Notes on the sheet
- (in symbol CAPACITOR POL) +
- (in symbol LM393, part A) +; -
- (in symbol LM393, part B) +; -
- (in symbol TitleBlock0) Title; Size; Document Number; Rev; Date:; Sheet; of

## Library data of the parts
C1-C4 C8 C10 C12 = CAP
C5 C9 C11 C13-C17 C20-C25 = CAP NP
C6 = CAP_Dup1
C18 C19 = CAPACITOR POL
J1 J2 = CON10A_2
R1-R8 R17 R22 R30-R80 = R_Dup1
R9-R16 R18-R21 R26-R29 = R
U1 U2 U42 = thachanh4c
U3 = EPCS16_0
U4 U5 = tlv1117cdcy_1: BoardLocation: ?; Instance: ?
U10 = ep1c12q240_5: PARTNUMBER: EP1C12Q240
U19-U27 = CT25244_13
U33-U35 = CY62256N_0
U36-U38 = CY14B101K_1
U39 = 7400_0_Dup1
Y1 = XTAL: Crystal Oscillator; Published: 8-Jun-2000; LatestRevisionDate: 17-Jul-2002; LatestRevisionNote: Re-released for DXP Platform.; PackageReference: R38; Publisher: Altium Limited; PackageDescription: Crystal, Thru-Hole; 2 Leads; Body 3.1 x 8.2 mm (Dia.xH)
* = TitleBlock0: Page Create Date: March  8, 1995; Page Count: 1